# Altium schematic sheet ffultra_main.SchDoc
size A4; SheetNumber: 1; SheetTotal: 13
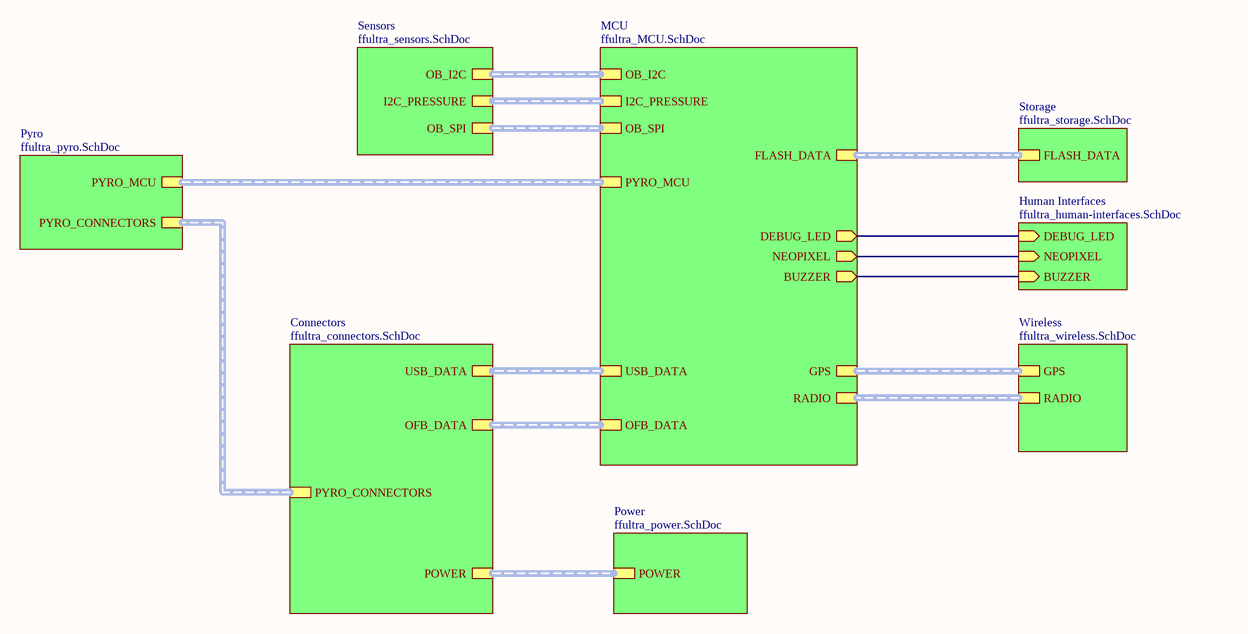
[diagram p0: ffultra_main.SchDoc]

## Sub-sheets
Connectors = ffultra_connectors.SchDoc: POWER (harness POWER_HARNESS), PYRO_CONNECTORS (harness PYRO_CONN_HARNESS), USB_DATA (harness USB), OFB_DATA (harness OFB_DATA_HARNESS)
Human Interfaces = ffultra_human-interfaces.SchDoc: DEBUG_LED (in), NEOPIXEL (in), BUZZER (in)
MCU = ffultra_MCU.SchDoc: FLASH_DATA (harness Flash_Data), PYRO_MCU (harness PYRO_MCU), GPS (harness GPS), OFB_DATA (harness OFB_DATA_HARNESS), OB_I2C (harness OB_I2C_HARNESS), OB_SPI (harness OB_SPI), RADIO (harness RADIO), I2C_PRESSURE (harness I2C PRESSURE), USB_DATA (harness USB), DEBUG_LED (out), NEOPIXEL (out), BUZZER (out)
Power = ffultra_power.SchDoc: POWER (harness Battery)
Pyro = ffultra_pyro.SchDoc: PYRO_MCU (harness PYRO_MCU), PYRO_CONNECTORS (harness Pyro Connectors)
Sensors = ffultra_sensors.SchDoc: OB_I2C (harness OB_I2C), OB_SPI (harness OB_SPI), I2C_PRESSURE (harness I2C PRESSURE)
Storage = ffultra_storage.SchDoc: FLASH_DATA (harness Flash_Data)
Wireless = ffultra_wireless.SchDoc: GPS (harness Flash_Data), RADIO (harness Flash_Data)

## Nets
(unnamed): sheet MCU/DEBUG_LED, sheet Human Interfaces/DEBUG_LED
(unnamed): sheet MCU/NEOPIXEL, sheet Human Interfaces/NEOPIXEL
(unnamed): sheet MCU/BUZZER, sheet Human Interfaces/BUZZER

## Buses and harness runs
harness sheet Connectors/OFB_DATA = sheet MCU/OFB_DATA
harness sheet Connectors/POWER = sheet Power/POWER
harness sheet Connectors/PYRO_CONNECTORS = sheet Pyro/PYRO_CONNECTORS
harness sheet Connectors/USB_DATA = sheet MCU/USB_DATA
harness sheet MCU/FLASH_DATA = sheet Storage/FLASH_DATA
harness sheet MCU/GPS = sheet Wireless/GPS
harness sheet MCU/I2C_PRESSURE = sheet Sensors/I2C_PRESSURE
harness sheet MCU/OB_I2C = sheet Sensors/OB_I2C
harness sheet MCU/OB_SPI = sheet Sensors/OB_SPI
harness sheet MCU/PYRO_MCU = sheet Pyro/PYRO_MCU
harness sheet MCU/RADIO = sheet Wireless/RADIO